# Altium schematic sheet Regulators.SchDoc
size A; SheetNumber: 5; SheetTotal: 6
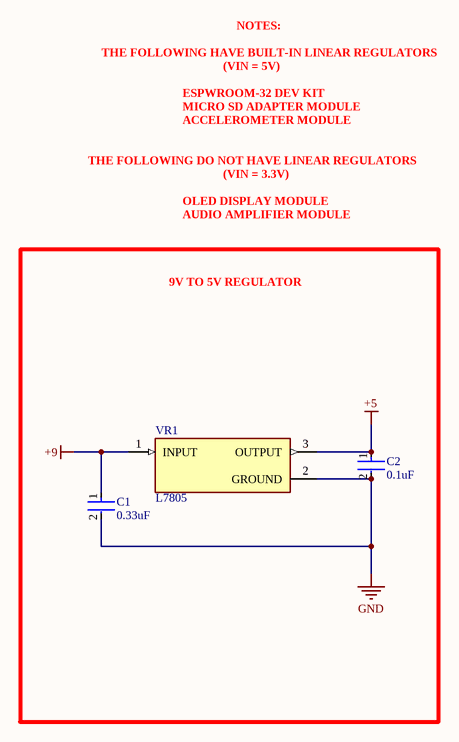
[diagram p0: Regulators.SchDoc]

## Parts
C1  0.33uF  [FP-RHE1DB-MFG]
C2  0.1uF  [FP-RHE1DB-MFG]
VR1  L7805  [TO255P1020X450X2000-3]

## Blocks framed on the sheet
9V TO 5V REGULATOR: C1 C2 VR1

## Nets
+5: C2.1 VR1.3(OUTPUT)
+9: C1.1 VR1.1(INPUT)
GND: C1.2 C2.2 VR1.2(GROUND)

## Notes on the sheet
- THE FOLLOWING HAVE BUILT-IN LINEAR REGULATORS
- (VIN = 5V)
- NOTES:
- MICRO SD ADAPTER MODULE
- ACCELEROMETER MODULE
- ESPWROOM-32 DEV KIT
- THE FOLLOWING DO NOT HAVE LINEAR REGULATORS
- OLED DISPLAY MODULE
- AUDIO AMPLIFIER MODULE
- (VIN = 3.3V)

## Library data of the parts
C1 C2 = CMP-06035-012170-1: Ceramic Capacitor Automotive 330nF ±10% 50V X8L Radial; Tolerance: 10%; Lead Pitch: 2.5mm; Capacitance: 330nF; Max Operating Temperature: 150°C; Dielectric: X8L; Voltage Rating: 50V; Voltage Rating (DC): 50V; Min Operating Temperature: -55°C; REACH SVHC: No SVHC
VR1 = L7805: Standard Regulator Pos 5V 1.5A 3-Pin(3+Tab) TO-220FP Tube; MF: STMicroelectronics; MP: L7805; Value: *; SnapEDA_Link: https://www.snapeda.com/parts/L7805/STMicroelectronics/view-part/?ref=snap; Price: None; Package: None; Check_prices: https://www.snapeda.com/parts/L7805/STMicroelectronics/view-part/?ref=eda; Availability: Not in stock